# Altium schematic sheet 10_Control.SchDoc
size A4; SheetNumber: 15; SheetTotal: 16
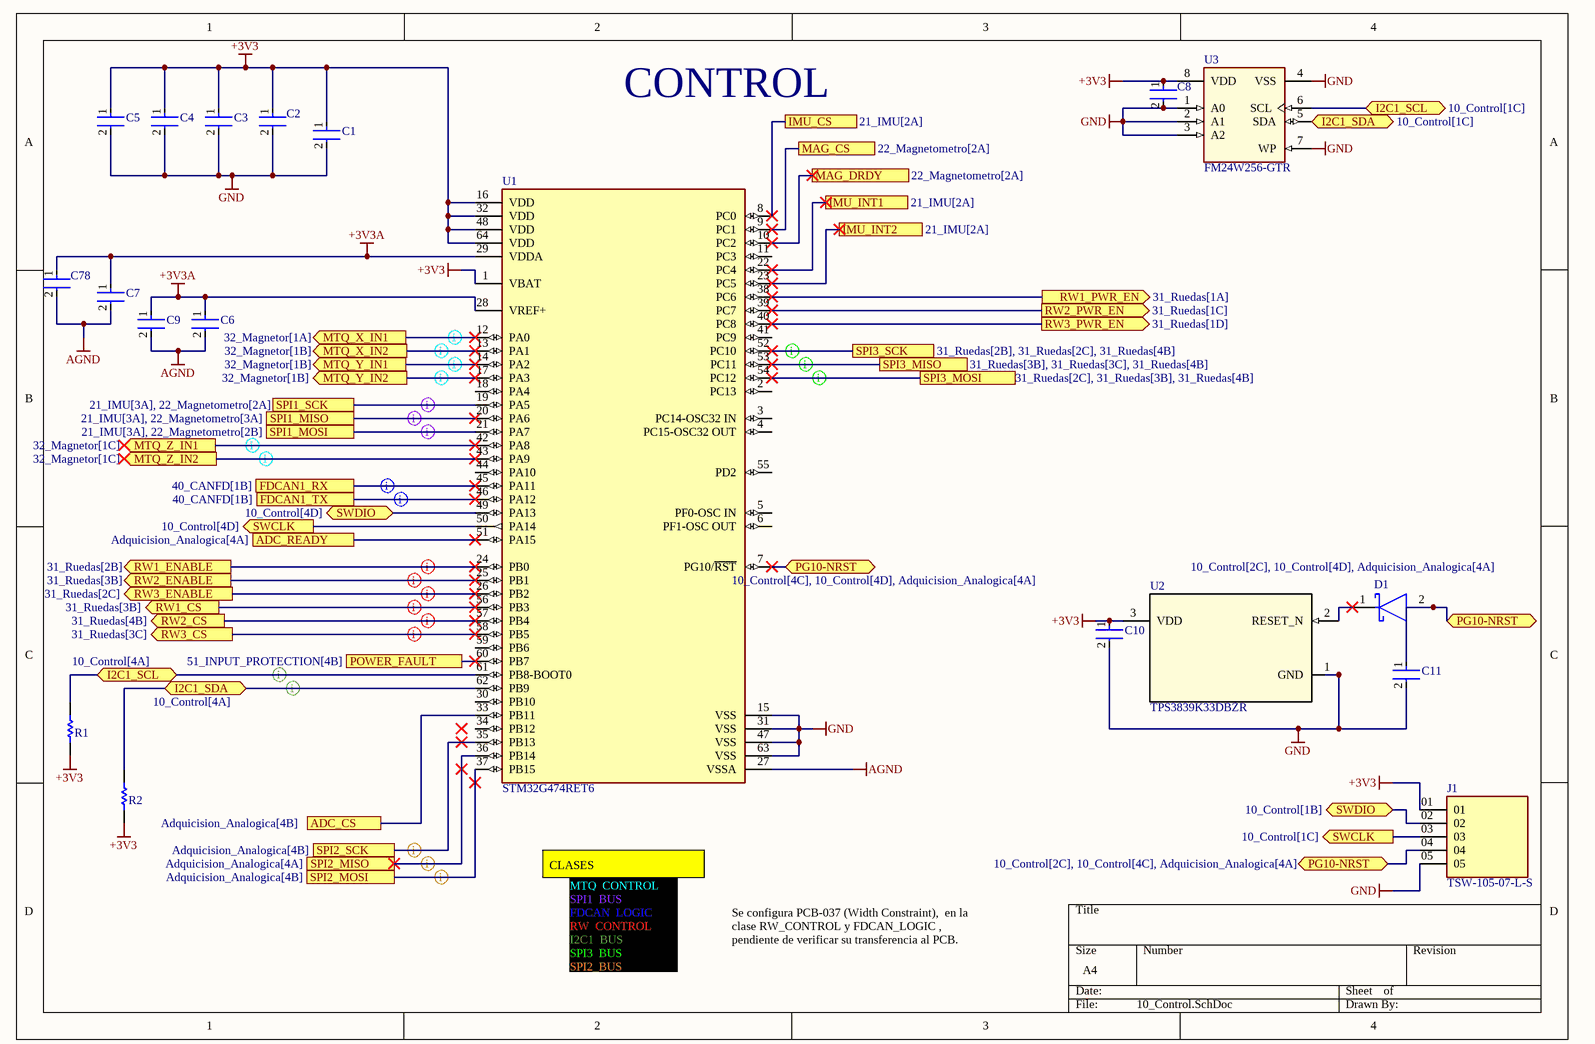
[diagram p0: 10_Control.SchDoc]

## Parts
C1  CC0603KRX7R7BB104  [FP-CC0603-DA-IPC_B]  (value not drawn)
C2  CC0603KRX7R7BB104  [FP-CC0603-DA-IPC_B]  (value not drawn)
C3  CC0603KRX7R7BB104  [FP-CC0603-DA-IPC_B]  (value not drawn)
C4  CC0603KRX7R7BB104  [FP-CC0603-DA-IPC_B]  (value not drawn)
C5  CC0805KKX7R6BB475  [FP-CC0805-0_85-IPC_C]  (value not drawn)
C6  CC0603KRX7R7BB104  [FP-CC0603-DA-IPC_B]  (value not drawn)
C7  CC0603KRX7R6BB105  [FP-CC0603-DA-IPC_B]  (value not drawn)
C8  CC0603KRX7R7BB104  [FP-CC0603-DA-IPC_B]  (value not drawn)
C9  CC0603KRX7R6BB105  [FP-CC0603-DA-IPC_B]  (value not drawn)
C10  CC0603KRX7R7BB104  [FP-CC0603-DA-IPC_B]  (value not drawn)
C11  CC0603KRX7R7BB104  [FP-CC0603-DA-IPC_B]  (value not drawn)
C78  C0603C103K3RACTU  [FP-C0603C-CF-IPC_B]  (value not drawn)
D1  BAT54J,115  [FP-SOD323F-MFG]  (value not drawn)
J1  TSW-105-07-L-S  [SAMTEC_TSW-105-07-L-S]
R1  RC0603FR-074K7L  [RESC1608X55X25NL10T15]  (value not drawn)
R2  RC0603FR-074K7L  [RESC1608X55X25NL10T15]  (value not drawn)
U1  STM32G474RET6  [FP-LQFP64-5W-IPC_C]
U2  TPS3839K33DBZR  [DBZ0003A_N]
U3  FM24W256-GTR  [SOIC127P602X173-8N-1-V]

## Ports
ADC_CS (see Adquicision_Analogica[4B]), ADC_READY (see Adquicision_Analogica[4A]), FDCAN1_RX (see 40_CANFD[1B]), FDCAN1_TX (see 40_CANFD[1B]), I2C1_SCL (bidir, see 10_Control[1C]), I2C1_SCL (bidir, see 10_Control[4A]), I2C1_SDA (bidir, see 10_Control[1C]), I2C1_SDA (bidir, see 10_Control[4A]), IMU_CS (see 21_IMU[2A]), IMU_INT1 (see 21_IMU[2A]), IMU_INT2 (see 21_IMU[2A]), MAG_CS (see 22_Magnetometro[2A]), MAG_DRDY (see 22_Magnetometro[2A]), MTQ_X_IN1 (out, see 32_Magnetor[1A]), MTQ_X_IN2 (out, see 32_Magnetor[1B]), MTQ_Y_IN1 (out, see 32_Magnetor[1B]), MTQ_Y_IN2 (out, see 32_Magnetor[1B]), MTQ_Z_IN1 (out, see 32_Magnetor[1C]), MTQ_Z_IN2 (out, see 32_Magnetor[1C]), PG10-NRST (bidir, see 10_Control[2C], 10_Control[4C], Adquicision_Analogica[4A]), PG10-NRST (bidir, see 10_Control[2C], 10_Control[4D], Adquicision_Analogica[4A]), PG10-NRST (bidir, see 10_Control[4C], 10_Control[4D], Adquicision_Analogica[4A]), POWER_FAULT (see 51_INPUT_PROTECTION[4B]), RW1_CS (out, see 31_Ruedas[3B]), RW1_ENABLE (out, see 31_Ruedas[2B]), RW1_PWR_EN (out, see 31_Ruedas[1A]), RW2_CS (out, see 31_Ruedas[4B]), RW2_ENABLE (out, see 31_Ruedas[3B]), RW2_PWR_EN (out, see 31_Ruedas[1C]), RW3_CS (out, see 31_Ruedas[3C]), RW3_ENABLE (out, see 31_Ruedas[2C]), RW3_PWR_EN (out, see 31_Ruedas[1D]), SPI1_MISO (see 21_IMU[3A], 22_Magnetometro[3A]), SPI1_MOSI (see 21_IMU[3A], 22_Magnetometro[2B]), SPI1_SCK (see 21_IMU[3A], 22_Magnetometro[2A]), SPI2_MISO (see Adquicision_Analogica[4A]), SPI2_MOSI (see Adquicision_Analogica[4B]), SPI2_SCK (see Adquicision_Analogica[4B]), SPI3_MISO (see 31_Ruedas[3B], 31_Ruedas[3C], 31_Ruedas[4B]), SPI3_MOSI (see 31_Ruedas[2C], 31_Ruedas[3B], 31_Ruedas[4B]), SPI3_SCK (see 31_Ruedas[2B], 31_Ruedas[2C], 31_Ruedas[4B]), SWCLK (out, see 10_Control[1C]), SWCLK (out, see 10_Control[4D]), SWDIO (bidir, see 10_Control[1B]), SWDIO (bidir, see 10_Control[4D])

## Nets
+3V3: C1.1 C2.1 C3.1 C4.1 C5.1 C8.1 C10.1 J1.01 R1.1 R2.1 U1.1(VBAT) U1.16(VDD) U1.32(VDD) U1.48(VDD) U1.64(VDD) U2.3(VDD) U3.8(VDD)
+3V3A: C6.1 C7.1 C9.1 C78.1 U1.28(VREF+) U1.29(VDDA)
AGND: C6.2 C7.2 C9.2 C78.2 U1.27(VSSA)
GND: C1.2 C2.2 C3.2 C4.2 C5.2 C8.2 C10.2 C11.2 J1.05 U1.15(VSS) U1.31(VSS) U1.47(VSS) U1.63(VSS) U2.1(GND) U3.1(A0) U3.2(A1) U3.3(A2) U3.4(VSS) U3.7(WP)
ADC_CS: U1.33(PB11) ; port ADC_CS
ADC_READY: U1.51(PA15) ; port ADC_READY
FDCAN1_RX: U1.45(PA11) ; port FDCAN1_RX
FDCAN1_TX: U1.46(PA12) ; port FDCAN1_TX
I2C1_SCL: R1.2 U1.61(PB8-BOOT0) U3.6(SCL) ; port I2C1_SCL
I2C1_SDA: R2.2 U1.62(PB9) U3.5(SDA) ; port I2C1_SDA
IMU_CS: U1.8(PC0) ; port IMU_CS
IMU_INT1: U1.22(PC4) ; port IMU_INT1
IMU_INT2: U1.23(PC5) ; port IMU_INT2
MAG_CS: U1.9(PC1) ; port MAG_CS
MAG_DRDY: U1.10(PC2) ; port MAG_DRDY
MTQ_X_IN1: U1.12(PA0) ; port MTQ_X_IN1
MTQ_X_IN2: U1.13(PA1) ; port MTQ_X_IN2
MTQ_Y_IN1: U1.14(PA2) ; port MTQ_Y_IN1
MTQ_Y_IN2: U1.17(PA3) ; port MTQ_Y_IN2
MTQ_Z_IN1: U1.42(PA8) ; port MTQ_Z_IN1
MTQ_Z_IN2: U1.43(PA9) ; port MTQ_Z_IN2
PG10-NRST: C11.1 D1.2(A) J1.04 U1.7(PG10/~{RST}) ; port PG10-NRST
POWER_FAULT: U1.60(PB7) ; port POWER_FAULT
RW1_CS: U1.56(PB3) ; port RW1_CS
RW1_ENABLE: U1.24(PB0) ; port RW1_ENABLE
RW1_PWR_EN: U1.38(PC6) ; port RW1_PWR_EN
RW2_CS: U1.57(PB4) ; port RW2_CS
RW2_ENABLE: U1.25(PB1) ; port RW2_ENABLE
RW2_PWR_EN: U1.39(PC7) ; port RW2_PWR_EN
RW3_CS: U1.58(PB5) ; port RW3_CS
RW3_ENABLE: U1.26(PB2) ; port RW3_ENABLE
RW3_PWR_EN: U1.40(PC8) ; port RW3_PWR_EN
SPI1_MISO: U1.20(PA6) ; port SPI1_MISO
SPI1_MOSI: U1.21(PA7) ; port SPI1_MOSI
SPI1_SCK: U1.19(PA5) ; port SPI1_SCK
SPI2_MISO: U1.36(PB14) ; port SPI2_MISO
SPI2_MOSI: U1.37(PB15) ; port SPI2_MOSI
SPI2_SCK: U1.35(PB13) ; port SPI2_SCK
SPI3_MISO: U1.53(PC11) ; port SPI3_MISO
SPI3_MOSI: U1.54(PC12) ; port SPI3_MOSI
SPI3_SCK: U1.52(PC10) ; port SPI3_SCK
SWCLK: J1.03 U1.50(PA14) ; port SWCLK
SWDIO: J1.02 U1.49(PA13) ; port SWDIO
NetD1_1: D1.1(C) U2.2(RESET_N)

Not connected (* = marked no-connect by the designer): U1 2(PC13) 3(PC14-OSC32_IN) 4(PC15-OSC32_OUT) 5(PF0-OSC_IN) 6(PF1-OSC_OUT) 11(PC3) 18(PA4) 30(PB10) 34(PB12) 41(PC9) 44(PA10) 55(PD2) 59(PB6)

## Layout directives
net class SPI3_BUS: SPI3_MISO, SPI3_MOSI, SPI3_SCK
net class RW_CONTROL; rule Width Constraint [Pref Width = 9.842mil    Min Width = 7.874mil    Max Width = 39.37mil]: RW1_ENABLE
net class RW_CONTROL: RW1_CS, RW2_CS, RW2_ENABLE, RW3_CS, RW3_ENABLE
net class MTQ_CONTROL: MTQ_X_IN1, MTQ_X_IN2, MTQ_Y_IN1, MTQ_Y_IN2, MTQ_Z_IN1, MTQ_Z_IN2
net class SPI1_BUS: SPI1_MISO, SPI1_MOSI, SPI1_SCK
net class SPI2_BUS: SPI2_MISO, SPI2_MOSI, SPI2_SCK
net class FDCAN_LOGIC; rule Width Constraint [Pref Width = 9.842mil    Min Width = 7.874mil    Max Width = 39.37mil]: FDCAN1_RX
net class FDCAN_LOGIC: FDCAN1_TX
net class I2C1_BUS: I2C1_SCL, I2C1_SDA

## Notes on the sheet
- CONTROL
- CLASES
- MTQ_CONTROL
- SPI1_BUS
- FDCAN_LOGIC
- RW_CONTROL
- I2C1_BUS
- SPI3_BUS
- SPI2_BUS
- Se configura PCB-037 (Width Constraint),  en la clase RW_CONTROL y FDCAN_LOGIC , pendiente de verificar su transferencia al PCB.

## Library data of the parts
C1-C4 C6 C8 C10 C11 = CMP-2000-05002-2: CAP CER 0.1UF 16V X7R 0603; Manufacturer: YAGEO; Tolerance: 0.1; Value: 100 nF; Temperature Coefficient: 15%; Material: Ceramic; Voltage Rating: 16 V; Package: CC0603-DA; ComponentLink2Description: Datasheet; Octopart: https://octopart.com/cc0603krx7r7bb104-yageo-192941; Temperature Range High: +125°C; Digikey Description: CAP CER 0.1UF 16V X7R 0603; Voltage: 16 V; Device Class L2: Capacitors; Height: 0.9mm; Temperature: -55°C to +125°C; Manufacturer Part Number: CC0603KRX7R7BB104; Device Class L1: Passive Components; Device Class L3: Ceramic Capacitors; ComponentLink2URL: http://www.yageo.com/documents/recent/UPY-GPHC_X7R_6.3V-to-50V_18.pdf; Footprint Url: http://www.yageo.com/exep/pages/download/literatures/UPY-C_GEN_24.pdf; RoHS: TRUE; Temperature Range Low: -55°C; Temperature Characteristic: X7R; Lead Free: Yes; Capacitance: 100 nF; Category: Cap; Mouser Description: Multilayer Ceramic Capacitor, CC Series, 0.1 - F, - 10%, X7R, 16 V, 0603 [1608 Metric]; Automotive: No
C5 = CMP-03422-001180-1: CAP CER 4.7UF 10V X7R 0805; Manufacturer: Yageo; Tolerance: 0.1; Material: Ceramic; ComponentLink2Description: Datasheet; ComponentLink2URL: http://www.yageo.com/documents/recent/UPY-GPHC_Y5V_6.3V-to-50V_8.pdf; Capacitance: 4.7 uF; Mouser Description: 0805 4.7 uF 10 V ±10% Tolerance X7R SMT Multilayer Ceramic Capacitor; Automotive: No; Value: 4.7 uF; Height: 0.95mm; Temperature: -30°C to +85°C; Temperature Range High: +85°C; Octopart: https://octopart.com/cc0805kkx7r6bb475-yageo-11543698; Footprint Url: http://www.yageo.com/exep/pages/download/literatures/UPY-C_GEN_24.pdf; Voltage Rating: 10 V; Temperature Range Low: -30°C; Lead Free: Yes; Device Class L3: Ceramic Capacitors; Digikey Description: CAP CER 4.7UF 10V X7R 0805; Temperature Characteristic: X7R; Category: Cap; Package: CC0805-0.85; Manufacturer Part Number: CC0805KKX7R6BB475; Device Class L1: Passive Components; Ipc Land Pattern Name: CAPC200125X85; RoHS: TRUE; Device Class L2: Capacitors
C7 C9 = CMP-03422-000835-1: CAP CER 1UF 10V X7R 0603; Manufacturer: YAGEO; Material: Ceramic; Temperature Coefficient: 15%; Tolerance: 0.1; Digikey Description: CAP CER 1UF 10V X7R 0603; Temperature: -55°C to +125°C; ComponentLink2URL: http://www.yageo.com/documents/recent/UPY-GPHC_X7R_6.3V-to-50V_18.pdf; Category: Cap; Voltage Rating: 10 V; Footprint Url: http://www.yageo.com/exep/pages/download/literatures/UPY-C_GEN_24.pdf; Mouser Description: Multilayer Ceramic Capacitors MLCC - SMD/SMT 1.0uF 10V X7R 10%; Device Class L3: Ceramic Capacitors; Temperature Characteristic: X7R; Automotive: No; Package: CC0603-DA; Temperature Range High: +125°C; Voltage: 10 V; Height: 0.9mm; Device Class L1: Passive Components; ComponentLink2Description: Datasheet; Lead Free: Yes; Octopart: https://octopart.com/cc0603krx7r6bb105-yageo-13184191; Capacitance: 1 uF; Manufacturer Part Number: CC0603KRX7R6BB105; Temperature Range Low: -55°C; RoHS: TRUE; Value: 1 uF; Device Class L2: Capacitors
C78 = CMP-2006-03040-2: CAP CER 10000PF 25V 10% X7R 0603; Manufacturer: KEMET; Material: Ceramic; Capacitance: 10,000 pF; Value: 10,000 pF; Tolerance: 0.1; Automotive Grade: Grade 1; Temperature Coefficient: 30ppm/°C; Lead Free: Yes; Temperature Range High: +125°C; Temperature Characteristic: X7R; Device Class L2: Capacitors; Mouser Description: Multilayer Ceramic Capacitors MLCC - SMD/SMT 25volts 10000pF X7R 10%; ComponentLink2Description: Datasheet; Height: 0.87mm; Digikey Description: CAP CER 10000PF 25V 10% X7R 0603; ComponentLink2URL: https://api.kemet.com/component-edge/download/datasheet/C0603C100J5GACAUTO.pdf; Octopart: https://octopart.com/c0603c103k3ractu-kemet-89103; Category: Cap; Package: C0603C-CF; Voltage Rating: 25 V; Device Class L3: Ceramic Capacitors; Automotive: Yes; RoHS: TRUE; Temperature: -55°C to +125°C; Temperature Range Low: -55°C; Device Class L1: Passive Components; Manufacturer Part Number: C0603C103K3RACTU
D1 = CMP-14398-000037-1: DIODE SCHOTTKY 30V 200MA SOD323F; RoHS Compliant: Yes
J1 = CMP-029-000000-1: MF: Samtec; Price: None; MP: TSW-105-07-L-S; Design Item ID: TSW-105-07-L-S; Package: None; Source: TSW-105-07-L-S.SchLib; Availability: Unavailable; Component Type: Standard; Pin Count: 5; Value: *
R1 R2 = CMP-2000-06942-1: Chip Resistor, 4.7 KOhm, +/- 1%, 0.1 W, -55 to 155 degC, 0603 (1608 Metric), RoHS, Tape and Reel; Manufacturer: Yageo; Power Rating: 100mW; Temperature Coefficient: 100PPM/C; Resistance: 4.7kOhms; Voltage Rating: 50V; Package Reference: 0603; Series: RC; Datasheet Version: Rev. 7, 05/2017; Packaging: Reel; Termination Style: SMD/SMT; Datasheet URL: http://www.yageo.com/documents/recent/PYu-RC_Group_51_RoHS_L_7.pdf; Manufacturer URL: http://www.yageo.com/; Package Description: 2-Pin Surface Mount Device, Body 1.6 x 0.8 mm; Case Code - mm: 1608; Case Code - in: 0603; Mounting Technology: SurfaceMount; Operating Temperature Range: -55Cto+155C; Tolerance: 1%; Product: ThickFilmResistorsGeneralPurpose
U1 = CMP-00030-00001-1: MCU 32-bit ARM Cortex M4 RISC 512KB Flash 1.8V/2.5V/3.3V 64-Pin LQFP Tray; Max Operating Temperature: 85°C; Min Operating Temperature: -40°C; Case/Package: LFQFP
U2 = CMP-022-000000-1: Ultra-low power, supply voltage supervisor 3-SOT-23 -40 to 85; Manufacturer_Name: Texas Instruments; Source: TPS3839K33DBZR.SchLib; RefDes: RefDes; TYPE: TYPE; Design Item ID: TPS3839K33DBZR; Manufacturer_Part_Number: TPS3839K33DBZR; Copyright: Copyright (C) 2025 Ultra Librarian. All rights reserved.
U3 = FM24W256-GTR: 256-Kbit Serial I2C F-RAM; Manufacturer: Infineon Technologies; Manufacturer Order Number: FM24W256-GTR; PackageReference: PG-DSO-8-802